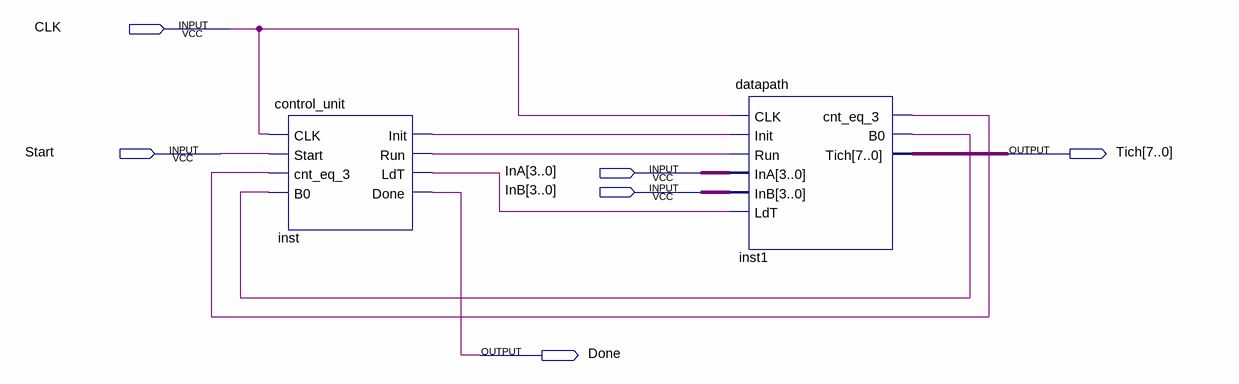
[diagram p0: schematic sheet]
// Quartus schematic nhan_2_so.bdf as structural Verilog: 2 symbols, 6 pins
module nhan_2_so (
  input  CLK,
  input  Start,
  input  [3:0] InA,
  input  [3:0] InB,
  output [7:0] Tich,
  output Done
);

  wire inst1_b0, inst1_cnt_eq_3, inst_init, inst_ldt, inst_run;

  control_unit inst (
    .CLK(CLK), .Start(Start), .cnt_eq_3(inst1_cnt_eq_3), .B0(inst1_b0), .Init(inst_init), .Run(inst_run),
    .LdT(inst_ldt), .Done(Done));
  datapath inst1 (
    .CLK(CLK), .Init(inst_init), .Run(inst_run), .InA(InA), .InB(InB), .LdT(inst_ldt),
    .cnt_eq_3(inst1_cnt_eq_3), .B0(inst1_b0), .Tich(Tich));
endmodule
